# Altium project ArmBand-Control-Board.PrjPcb (part 3 of 3)

## Sheet Opamp-Sheet1.SchDoc
size A4; SheetNumber: 6; SheetTotal: 11
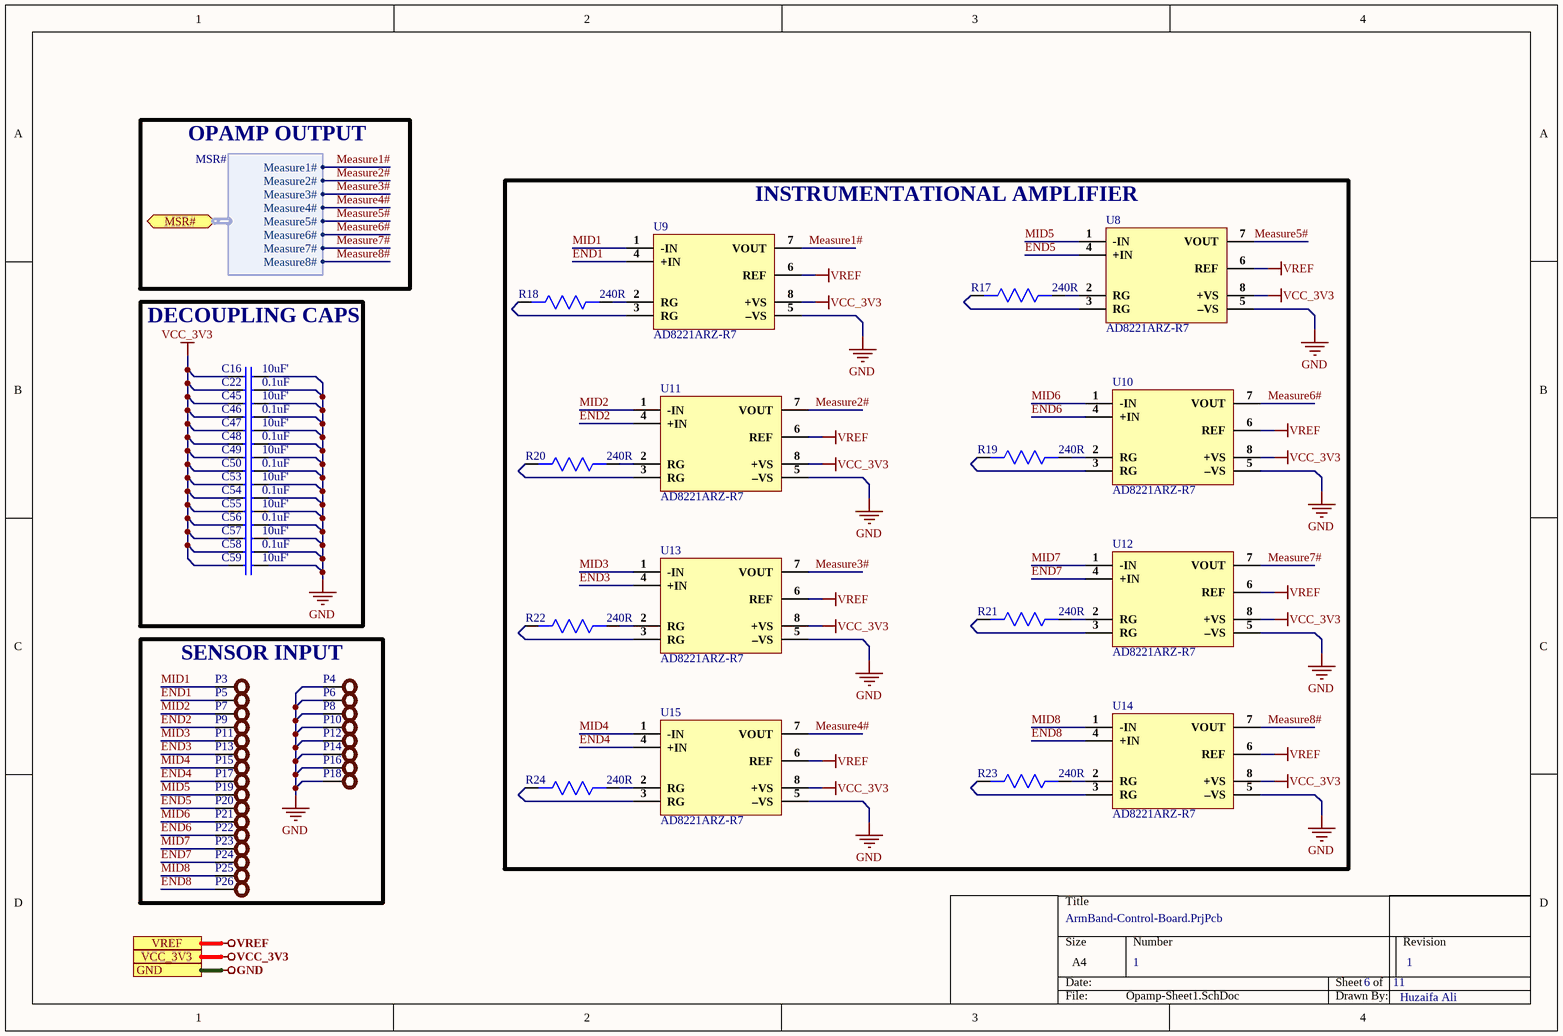
[diagram p9: Opamp-Sheet1.SchDoc]

### Parts
C16  10uF'  [Cap0603]
C22  0.1uF  [Cap 0402]
C45  10uF'  [Cap0603]
C46  0.1uF  [Cap 0402]
C47  10uF'  [Cap0603]
C48  0.1uF  [Cap 0402]
C49  10uF'  [Cap0603]
C50  0.1uF  [Cap 0402]
C53  10uF'  [Cap0603]
C54  0.1uF  [Cap 0402]
C55  10uF'  [Cap0603]
C56  0.1uF  [Cap 0402]
C57  10uF'  [Cap0603]
C58  0.1uF  [Cap 0402]
C59  10uF'  [Cap0603]
P3  Test Point  [TEST POINT]  (value not drawn)
P4  Test Point  [TEST POINT]  (value not drawn)
P5  Test Point  [TEST POINT]  (value not drawn)
P6  Test Point  [TEST POINT]  (value not drawn)
P7  Test Point  [TEST POINT]  (value not drawn)
P8  Test Point  [TEST POINT]  (value not drawn)
P9  Test Point  [TEST POINT]  (value not drawn)
P10  Test Point  [TEST POINT]  (value not drawn)
P11  Test Point  [TEST POINT]  (value not drawn)
P12  Test Point  [TEST POINT]  (value not drawn)
P13  Test Point  [TEST POINT]  (value not drawn)
P14  Test Point  [TEST POINT]  (value not drawn)
P15  Test Point  [TEST POINT]  (value not drawn)
P16  Test Point  [TEST POINT]  (value not drawn)
P17  Test Point  [TEST POINT]  (value not drawn)
P18  Test Point  [TEST POINT]  (value not drawn)
P19  Test Point  [TEST POINT]  (value not drawn)
P20  Test Point  [TEST POINT]  (value not drawn)
P21  Test Point  [TEST POINT]  (value not drawn)
P22  Test Point  [TEST POINT]  (value not drawn)
P23  Test Point  [TEST POINT]  (value not drawn)
P24  Test Point  [TEST POINT]  (value not drawn)
P25  Test Point  [TEST POINT]  (value not drawn)
P26  Test Point  [TEST POINT]  (value not drawn)
R17  240R  [Res0402]
R18  240R  [Res0402]
R19  240R  [Res0402]
R20  240R  [Res0402]
R21  240R  [Res0402]
R22  240R  [Res0402]
R23  240R  [Res0402]
R24  240R  [Res0402]
U8  AD8221ARZ-R7  [SOIC-8]
U9  AD8221ARZ-R7  [SOIC-8]
U10  AD8221ARZ-R7  [SOIC-8]
U11  AD8221ARZ-R7  [SOIC-8]
U12  AD8221ARZ-R7  [SOIC-8]
U13  AD8221ARZ-R7  [SOIC-8]
U14  AD8221ARZ-R7  [SOIC-8]
U15  AD8221ARZ-R7  [SOIC-8]

### Blocks framed on the sheet
INSTRUMENTATIONAL AMPLIFIER: R17-R24 U8-U15
DECOUPLING CAPS: C16 C22 C45-C50 C53-C59
SENSOR INPUT: P3-P26

### Ports
GND, MSR# (bidir, harness MSR#), VCC_3V3, VREF

### Harnesses
MSR#: Measure1#, Measure2#, Measure3#, Measure4#, Measure5#, Measure6#, Measure7#, Measure8#

### Nets
GND: C16.2 C22.2 C45.2 C46.2 C47.2 C48.2 C49.2 C50.2 C53.2 C54.2 C55.2 C56.2 C57.2 C58.2 C59.2 P4.1 P6.1 P8.1 P10.1 P12.1 P14.1 P16.1 P18.1 U8.5(–VS) U9.5(–VS) U10.5(–VS) U11.5(–VS) U12.5(–VS) U13.5(–VS) U14.5(–VS) U15.5(–VS) ; port GND
VCC_3V3: C16.1 C22.1 C45.1 C46.1 C47.1 C48.1 C49.1 C50.1 C53.1 C54.1 C55.1 C56.1 C57.1 C58.1 C59.1 U8.8(+VS) U9.8(+VS) U10.8(+VS) U11.8(+VS) U12.8(+VS) U13.8(+VS) U14.8(+VS) U15.8(+VS) ; port VCC_3V3
VREF: U8.6(REF) U9.6(REF) U10.6(REF) U11.6(REF) U12.6(REF) U13.6(REF) U14.6(REF) U15.6(REF) ; port VREF
END1: P5.1 U9.4(+IN)
END2: P9.1 U11.4(+IN)
END3: P13.1 U13.4(+IN)
END4: P17.1 U15.4(+IN)
END5: P20.1 U8.4(+IN)
END6: P22.1 U10.4(+IN)
END7: P24.1 U12.4(+IN)
END8: P26.1 U14.4(+IN)
Measure1#: U9.7(VOUT) ; port MSR#.Measure1#
Measure2#: U11.7(VOUT) ; port MSR#.Measure2#
Measure3#: U13.7(VOUT) ; port MSR#.Measure3#
Measure4#: U15.7(VOUT) ; port MSR#.Measure4#
Measure5#: U8.7(VOUT) ; port MSR#.Measure5#
Measure6#: U10.7(VOUT) ; port MSR#.Measure6#
Measure7#: U12.7(VOUT) ; port MSR#.Measure7#
Measure8#: U14.7(VOUT) ; port MSR#.Measure8#
MID1: P3.1 U9.1(-IN)
MID2: P7.1 U11.1(-IN)
MID3: P11.1 U13.1(-IN)
MID4: P15.1 U15.1(-IN)
MID5: P19.1 U8.1(-IN)
MID6: P21.1 U10.1(-IN)
MID7: P23.1 U12.1(-IN)
MID8: P25.1 U14.1(-IN)
NetR17_1: R17.1 U8.2(RG)
NetR17_2: R17.2 U8.3(RG)
NetR18_1: R18.1 U9.2(RG)
NetR18_2: R18.2 U9.3(RG)
NetR19_1: R19.1 U10.2(RG)
NetR19_2: R19.2 U10.3(RG)
NetR20_1: R20.1 U11.2(RG)
NetR20_2: R20.2 U11.3(RG)
NetR21_1: R21.1 U12.2(RG)
NetR21_2: R21.2 U12.3(RG)
NetR22_1: R22.1 U13.2(RG)
NetR22_2: R22.2 U13.3(RG)
NetR23_1: R23.1 U14.2(RG)
NetR23_2: R23.2 U14.3(RG)
NetR24_1: R24.1 U15.2(RG)
NetR24_2: R24.2 U15.3(RG)

### Notes on the sheet
- OPAMP OUTPUT
- 1
- Huzaifa Ali

### Library data of the parts
C16 C45 C47 C49 C53 C55 C57 C59 = CL10A106MA8NRNC: CAP CER 10UF 25V X5R 0603; Manufacturer: Samsung; Tolerance: 20%; Supplier 1: Avnet; Manufacturer Part Number: CL10A106MA8NRNC; RoHS: Yes; Category: Ceramic Capacitors; Pricing 1: 4000=0.03753, 8000=0.03700, 16000=0.03595, 24000=0.03515, 32000=0.03383, 40000=0.03304, 400000=0.03225 (USD); Mount: Surface Mount; Case/Package: 0603; Case Code (Metric): 1608; Case Code (Imperial): 0603; Contact Plating: Tin; Min Operating Temperature: -55°C; Max Operating Temperature: 85°C; Package Quantity: 1; Packaging: Tape and Reel; Capacitance: 10uF; Voltage Rating: 25V; Dielectric: X5R; Termination: Wraparound; Series: CL; Construction: Flat; Length: 0.063inch; Width: 0.031inch; Thickness: 0.035inch; Lead Free: Lead Free; RoHS Compliant: Yes; ComponentLink1URL: https://datasheet.ciiva.com/25766/cl10a106ma8nrnc-25766562.pdf?src-supplier=Digi-Key; ComponentLink1Description: https://datasheet.ciiva.com/25766/cl10a106ma8nrnc-25766562.pdf?src-supplier=Digi-Key; Supplier Part Number 1: CL10A106MA8NRNC
C22 C46 C48 C50 C54 C56 C58 = GRM155R71H104ME14D: CAP CER 0.1UF 50V X7R 0402; Manufacturer: Murata; Tolerance: 20%; Capacitance: 100nF; Supplier 1: Digi-Key; Manufacturer Part Number: GRM155R71H104ME14D; Stock 1: 439844; Pricing 1: 1=0.1, 10=0.038, 100=0.0168, 500=0.01198, 1000=0.00941, 2500=0.00855, 5000=0.00787 (USD); Mount: Surface Mount; Case/Package: 0402; Min Operating Temperature: -55°C; Max Operating Temperature: 125°C; Packaging: Cut Tape; Voltage Rating: 50V; Length: 0.039inch; Width: 0.02inch; Thickness: 0.022inch; ComponentLink1URL: http://search.murata.co.jp/Ceramy/image/img/A01X/G101/ENG/GRM155R71H104ME14-01.pdf?src-supplier=Digi-Key; ComponentLink1Description: http://search.murata.co.jp/Ceramy/image/img/A01X/G101/ENG/GRM155R71H104ME14-01.pdf?src-supplier=Digi-Key; ComponentLink2URL: http://psearch.en.murata.com/capacitor/product/GRM155R71H104ME14%23.pdf?src-supplier=Avnet; ComponentLink2Description: http://psearch.en.murata.com/capacitor/product/GRM155R71H104ME14%23.pdf?src-supplier=Avnet; ComponentLink3URL: http://components.arrow.com/part/dataview/0323_07177683?src-supplier=Arrow+Europe; ComponentLink3Description: http://components.arrow.com/part/dataview/0323_07177683?src-supplier=Arrow+Europe; ComponentLink4URL: http://www.mouser.com/ds/2/281/c02e-2905.pdf?src-supplier=Mouser; ComponentLink4Description: http://www.mouser.com/ds/2/281/c02e-2905.pdf?src-supplier=Mouser; Supplier Part Number 1: 490-10701-1-ND
P3-P26 = TEST POINT: Test Point ON
R17-R24 = RC0402FR-07240RL: RES SMD 0402 240 Ohm 1% 1/16W ±100ppm/°C Molded SMD Paper T/R; Manufacturer: Yageo; Power Rating: 63mW; Voltage Rating (DC): 50V; Supplier 1: Arrow Electronics; Manufacturer Part Number: RC0402FR-07240RL; RoHS: Yes; Category: Chip SMD Resistors; Stock 1: 3138480; Pricing 1: 10000=0.00190 (USD); Case/Package: 0402; Case Code (Metric): 1005; Case Code (Imperial): 0402; Size Code: 0402; Min Operating Temperature: -55°C; Max Operating Temperature: 155°C; Resistance: 240R; Tolerance: 1%; Packaging: Tape and Reel; Resistor Type: Thick Film; Temperature Coefficient: 100ppm/°C; Voltage Rating: 50V; Package Quantity: 1; Number of Terminations: 2; Termination: SMD/SMT; Max Power Dissipation: 63mW; Features: Moisture Resistant; Series: RC; Construction: Rectangular; Resistance Tolerance: 1%; Length: 1mm; Width: 0.02inch; Height: 0.016inch; Depth: 0.5mm; REACH SVHC: Unknown; Lead Free: Lead Free; RoHS Compliant: Yes; Military Standard: Not; ComponentLink1URL: https://datasheet.ciiva.com/7849/1018594-7849915.pdf?src-supplier=Element14; ComponentLink1Description: https://datasheet.ciiva.com/7849/1018594-7849915.pdf?src-supplier=Element14; ComponentLink2URL: https://datasheet.ciiva.com/7849/1018594-7849916.pdf?src-supplier=Element14; ComponentLink2Description: https://datasheet.ciiva.com/7849/1018594-7849916.pdf?src-supplier=Element14; ComponentLink3URL: https://datasheet.ciiva.com/2519/pyu-r-int-thick-7-2519157.pdf?src-supplier=Digi-Key; ComponentLink3Description: https://datasheet.ciiva.com/2519/pyu-r-int-thick-7-2519157.pdf?src-supplier=Digi-Key; ComponentLink4URL: https://datasheet.ciiva.com/2519/pyu-r-int-thick-7-2519158.pdf?src-supplier=Digi-Key; ComponentLink4Description: https://datasheet.ciiva.com/2519/pyu-r-int-thick-7-2519158.pdf?src-supplier=Digi-Key; ComponentLink5URL: https://datasheet.ciiva.com/2519/pyu-r-int-thick-7-2519156.pdf?src-supplier=Digi-Key; ComponentLink5Description: https://datasheet.ciiva.com/2519/pyu-r-int-thick-7-2519156.pdf?src-supplier=Digi-Key; ComponentLink6URL: https://datasheet.ciiva.com/12669/pyu-rc0402-51-rohs-l-6-r-12669689.pdf?src-supplier=Mouser; ComponentLink6Description: https://datasheet.ciiva.com/12669/pyu-rc0402-51-rohs-l-6-r-12669689.pdf?src-supplier=Mouser; ComponentLink7URL: https://datasheet.ciiva.com/17419/pyu-rc0402-51-rohs-l-6-r-17419482.pdf?src-supplier=Future+Electronics; ComponentLink7Description: https://datasheet.ciiva.com/17419/pyu-rc0402-51-rohs-l-6-r-17419482.pdf?src-supplier=Future+Electronics; Supplier Part Number 1: RC0402FR-07240RL
U8-U15 = AD8221ARZ-R7: IC OPAMP INSTR 825KHZ 8SOIC; Manufacturer: Analog Devices; Number of Channels: 1; Common Mode Rejection Ratio: 80dB; Min Dual Supply Voltage: 2.3V; Max Dual Supply Voltage: 18V; Slew Rate: 2.5V/µs; Nominal Supply Current: 1mA; Max Power Dissipation: 200mW; Bandwidth: 562kHz; Input Bias Current: 1.5nA; Input Offset Voltage (Vos): 60uV; Output Current per Channel: 18mA; Power Supply Rejection Ratio (PSRR): 130dB; Voltage Gain: 60dB; Input Resistance: 100GR; Quiescent Current: 900uA; Operating Supply Voltage: 36V; Supplier 1: Mouser; Manufacturer Part Number: AD8221ARZ-R7; RoHS: Yes; Category: Amplifiers - Op Amps, Buffer, Instrumentation; Pricing 1: 1=7.37000, 10=6.66000, 25=6.35000, 50=6.35000, 100=5.51000, 250=5.27000, 500=4.80000, 1000=4.37000, 10000=4.37000 (USD); Case/Package: SOIC; Number of Pins: 8; Contact Plating: Tin,Matte; Min Operating Temperature: -40°C; Max Operating Temperature: 85°C; -3db Bandwidth: 825kHz; Package Quantity: 1000; Packaging: Tape and Reel; Number of Circuits: 1; Operating Supply Current: 1mA; Number of Elements: 1; Power Dissipation: 200mW; Series: -; Supply Current: 1mA; Radiation Hardening: No; Lead Free: Contains Lead; RoHS Compliant: Yes; ComponentLink1URL: https://datasheet.ciiva.com/15128/getdatasheetpartid-313520-15128733.pdf?src-supplier=Verical; ComponentLink1Description: https://datasheet.ciiva.com/15128/getdatasheetpartid-313520-15128733.pdf?src-supplier=Verical; ComponentLink2URL: https://datasheet.ciiva.com/2975/ad8221-2975658.pdf?src-supplier=Avnet; ComponentLink2Description: https://datasheet.ciiva.com/2975/ad8221-2975658.pdf?src-supplier=Avnet; ComponentLink3URL: https://datasheet.ciiva.com/2975/ad8221-2975980.pdf?src-supplier=Avnet; ComponentLink3Description: https://datasheet.ciiva.com/2975/ad8221-2975980.pdf?src-supplier=Avnet; ComponentLink4URL: https://datasheet.ciiva.com/6628/ad8221-6628618.pdf?src-supplier=Digi-Key; ComponentLink4Description: https://datasheet.ciiva.com/6628/ad8221-6628618.pdf?src-supplier=Digi-Key; ComponentLink5URL: https://datasheet.ciiva.com/6628/ad8221-6628619.pdf?src-supplier=Digi-Key; ComponentLink5Description: https://datasheet.ciiva.com/6628/ad8221-6628619.pdf?src-supplier=Digi-Key; ComponentLink6URL: https://datasheet.ciiva.com/6628/ad8221-6628617.pdf?src-supplier=Digi-Key; ComponentLink6Description: https://datasheet.ciiva.com/6628/ad8221-6628617.pdf?src-supplier=Digi-Key; ComponentLink7URL: https://datasheet.ciiva.com/48709/001249009-da-01-en-ic-amp-inst-prec-ad8221arz-r7-soic-8-adi-48709526.pdf?src-supplier=Conrad; ComponentLink7Description: https://datasheet.ciiva.com/48709/001249009-da-01-en-ic-amp-inst-prec-ad8221arz-r7-soic-8-adi-48709526.pdf?src-supplier=Conrad; Supplier Part Number 1: 584-AD8221ARZ-R7

## Sheet Opamp-Sheet2.SchDoc
size A4; SheetNumber: 11; SheetTotal: 12
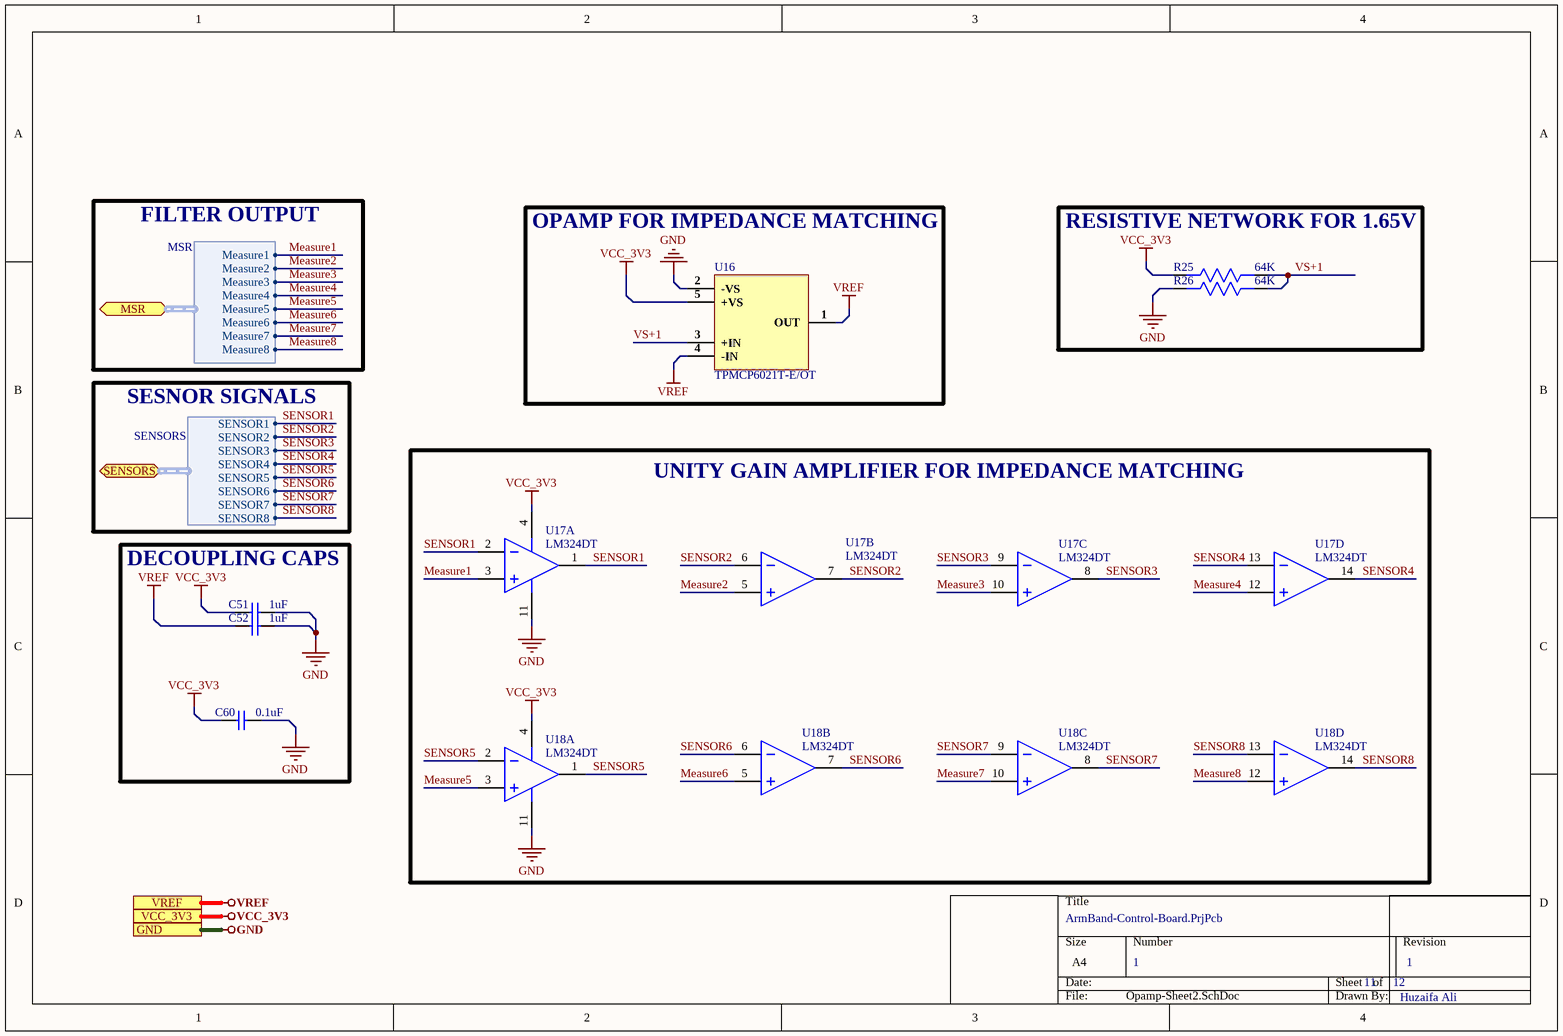
[diagram p10: Opamp-Sheet2.SchDoc]

### Parts
C51  1uF  [Cap 0402]
C52  1uF  [Cap 0402]
C60  0.1uF  [Cap 0402]
R25  64K  [Res0603]
R26  64K  [Res0603]
U16  TPMCP6021T-E/OT  [SOT-23-5]
U17  LM324DT  [SO-14]  (parts A,B,C,D of 4)
U18  LM324DT  [SO-14]  (parts A,B,C,D of 4)

### Blocks framed on the sheet
OPAMP FOR IMPEDANCE MATCHING: U16
RESISTIVE NETWORK FOR 1.65V: R25 R26
UNITY GAIN AMPLIFIER FOR IMPEDANCE MATCHING: U17 U18
DECOUPLING CAPS: C51 C52 C60

### Ports
GND, MSR (bidir, harness MSR), SENSORS (bidir, harness SENSORS), VCC_3V3, VREF

### Harnesses
SENSORS: SENSOR1, SENSOR2, SENSOR3, SENSOR4, SENSOR5, SENSOR6, SENSOR7, SENSOR8
MSR: Measure1, Measure2, Measure3, Measure4, Measure5, Measure6, Measure7, Measure8

### Nets
GND: C51.2 C52.2 C60.2 R26.2 U16.2(-VS) U17.11(VCC-) U18.11(VCC-) ; port GND
VCC_3V3: C51.1 C60.1 R25.2 U16.5(+VS) U17.4(VCC+) U18.4(VCC+) ; port VCC_3V3
VREF: C52.1 U16.1(OUT) U16.4(-IN) ; port VREF
Measure1: U17.3(IN+) ; port MSR.Measure1
Measure2: U17.5(2IN+) ; port MSR.Measure2
Measure3: U17.10(3IN+) ; port MSR.Measure3
Measure4: U17.12(4IN+) ; port MSR.Measure4
Measure5: U18.3(IN+) ; port MSR.Measure5
Measure6: U18.5(2IN+) ; port MSR.Measure6
Measure7: U18.10(3IN+) ; port MSR.Measure7
Measure8: U18.12(4IN+) ; port MSR.Measure8
SENSOR1: U17.1(1OUT) U17.2(IN-) ; port SENSORS.SENSOR1
SENSOR2: U17.6(2IN-) U17.7(2OUT) ; port SENSORS.SENSOR2
SENSOR3: U17.8(3OUT) U17.9(3IN-) ; port SENSORS.SENSOR3
SENSOR4: U17.13(4IN-) U17.14(4OUT) ; port SENSORS.SENSOR4
SENSOR5: U18.1(1OUT) U18.2(IN-) ; port SENSORS.SENSOR5
SENSOR6: U18.6(2IN-) U18.7(2OUT) ; port SENSORS.SENSOR6
SENSOR7: U18.8(3OUT) U18.9(3IN-) ; port SENSORS.SENSOR7
SENSOR8: U18.13(4IN-) U18.14(4OUT) ; port SENSORS.SENSOR8
VS+1: R25.1 R26.1 U16.3(+IN)

### Notes on the sheet
- FILTER OUTPUT
- SESNOR SIGNALS
- 1
- Huzaifa Ali

### Library data of the parts
C51 C52 = CC0402KRX5R7BB105: CAP CER 1UF 16V X5R 0402; Manufacturer: Yageo; Tolerance: 10%; Supplier 1: Digi-Key; Manufacturer Part Number: CC0402KRX5R7BB105; Stock 1: 1405667; Pricing 1: 1=0.36, 10=0.252, 100=0.1512, 500=0.1134, 1000=0.09576, 2500=0.09072, 5000=0.08568 (USD); Mount: Surface Mount; Case/Package: 0402; Weight: 2.3E-05oz; Case Code (Imperial): 0402; Case Code (Metric): 1005; Min Operating Temperature: -55°C; Max Operating Temperature: 85°C; Capacitance: 1uF; Dielectric: X5R; Packaging: Tape and Reel; Voltage Rating (DC): 16V; Voltage Rating: 16V; Termination: SMD/SMT; Composition: Ceramic; Length: 1mm; Height: 0.5mm; Width: 0.02inch; Thickness: 0.022inch; Depth: 0.5mm; Radiation Hardening: No; Lead Free: Lead Free; Halogen Free: Halogen Free; ComponentLink1URL: http://www.yageo.com/documents/recent/UPY-GPHC_X5R_4V-to-50V_12.pdf?src-supplier=Avnet+Europe; ComponentLink1Description: http://www.yageo.com/documents/recent/UPY-GPHC_X5R_4V-to-50V_12.pdf?src-supplier=Avnet+Europe; Supplier Part Number 1: 311-1691-6-ND
C60 = GRM155R71H104ME14D: as C22 on sheet Opamp-Sheet1; Supplier 1: Digi-Key; Manufacturer Part Number: GRM155R71H104ME14D; Stock 1: 439844; Pricing 1: 1=0.1, 10=0.038, 100=0.0168, 500=0.01198, 1000=0.00941, 2500=0.00855, 5000=0.00787 (USD); Mount: Surface Mount; Case/Package: 0402; Min Operating Temperature: -55°C; Max Operating Temperature: 125°C; Packaging: Cut Tape; Voltage Rating: 50V; Length: 0.039inch; Width: 0.02inch; Thickness: 0.022inch; ComponentLink1URL: http://search.murata.co.jp/Ceramy/image/img/A01X/G101/ENG/GRM155R71H104ME14-01.pdf?src-supplier=Digi-Key; ComponentLink1Description: http://search.murata.co.jp/Ceramy/image/img/A01X/G101/ENG/GRM155R71H104ME14-01.pdf?src-supplier=Digi-Key; ComponentLink2URL: http://psearch.en.murata.com/capacitor/product/GRM155R71H104ME14%23.pdf?src-supplier=Avnet; ComponentLink2Description: http://psearch.en.murata.com/capacitor/product/GRM155R71H104ME14%23.pdf?src-supplier=Avnet; ComponentLink3URL: http://components.arrow.com/part/dataview/0323_07177683?src-supplier=Arrow+Europe; ComponentLink3Description: http://components.arrow.com/part/dataview/0323_07177683?src-supplier=Arrow+Europe; ComponentLink4URL: http://www.mouser.com/ds/2/281/c02e-2905.pdf?src-supplier=Mouser; ComponentLink4Description: http://www.mouser.com/ds/2/281/c02e-2905.pdf?src-supplier=Mouser; Supplier Part Number 1: 490-10701-1-ND
R25 R26 = ARG03DTC6402N: 1/10W Thin Film Resistor 75V ±0.5% ±25ppm/℃ -55℃~+155℃ 64kΩ 0603 Chip Resistor - Surface Mount ROHS; Manufacturer: iking Tech; Manufacture Part num:: ARG03DTC6402N; Package: 0603; VAlue: 64K
U16 = TPMCP6021T-E/OT: SOT-23-5 Operational Amplifier ROHS; Manufaturere: TECH PUBLIC; Manufacture Part num:: TPMCP6021T-E/OT; Package: SOT-23-5
U17 U18 = LM324DT: IC OPAMP GP 1.3MHZ 14SO; Manufacturer: STMicroelectronics; Max Supply Voltage: 30V; Min Supply Voltage: 3V; Min Dual Supply Voltage: 1.5V; Max Dual Supply Voltage: 15V; Voltage Gain: 100dB; Slew Rate: 0.4V/µs; Common Mode Rejection Ratio: 70dB; Nominal Supply Current: 1.2mA; Input Offset Voltage (Vos): 7mV; Input Bias Current: 150nA; Number of Circuits: 4; Output Current per Channel: 40mA; Dual Supply Voltage: 12V; Supply Type: Single,Dual; Input Voltage Noise Density: 40nV/sqrt Hz; Max Power Dissipation: 400mW; Supplier 1: Arrow Electronics; Manufacturer Part Number: LM324DT; RoHS: Yes; Category: Amplifiers - Op Amps, Buffer, Instrumentation; Stock 1: 287500; Pricing 1: 2500=0.18900 (USD); Mount: Surface Mount; Case/Package: SO; Number of Pins: 14; Contact Plating: Tin,Matte; Weight: 0.009143oz; Min Operating Temperature: 0°C; Max Operating Temperature: 70°C; Gain Bandwidth Product: 1.3MHz; Packaging: Cut Tape; Package Quantity: 2500; Operating Supply Current: 1.2mA; Operating Supply Voltage: 15V; Number of Channels: 4; Output Current: 40mA; Number of Elements: 4; Series: LM324; Technology: BIPOLAR; Bandwidth: 1.3MHz; Number of Amplifiers: 4; Unity Gain Bandwidth Product: 1.3MHz; Length: 8.75mm; Width: 4mm; Height: 1.65mm; Radiation Hardening: No; RoHS Compliant: Yes; Lead Free: Lead Free; REACH SVHC: No SVHC; ComponentLink1URL: https://datasheet.ciiva.com/4758/cd00000457-103203-4758032.pdf?src-supplier=Mouser; ComponentLink1Description: https://datasheet.ciiva.com/4758/cd00000457-103203-4758032.pdf?src-supplier=Mouser; ComponentLink2URL: https://datasheet.ciiva.com/8008/1834360-8008827.pdf?src-supplier=Element14; ComponentLink2Description: https://datasheet.ciiva.com/8008/1834360-8008827.pdf?src-supplier=Element14; ComponentLink3URL: https://datasheet.ciiva.com/8008/1834360-8008490.pdf?src-supplier=Element14; ComponentLink3Description: https://datasheet.ciiva.com/8008/1834360-8008490.pdf?src-supplier=Element14; ComponentLink4URL: https://datasheet.ciiva.com/28630/1834360-28630538.pdf?src-supplier=Element14; ComponentLink4Description: https://datasheet.ciiva.com/28630/1834360-28630538.pdf?src-supplier=Element14; ComponentLink5URL: https://datasheet.ciiva.com/1795/cd00000457-1795560.pdf?src-supplier=Digi-Key; ComponentLink5Description: https://datasheet.ciiva.com/1795/cd00000457-1795560.pdf?src-supplier=Digi-Key; ComponentLink6URL: https://datasheet.ciiva.com/1795/cd00000457-1795559.pdf?src-supplier=Digi-Key; ComponentLink6Description: https://datasheet.ciiva.com/1795/cd00000457-1795559.pdf?src-supplier=Digi-Key; ComponentLink7URL: https://datasheet.ciiva.com/1795/cd00000457-1795561.pdf?src-supplier=Digi-Key; ComponentLink7Description: https://datasheet.ciiva.com/1795/cd00000457-1795561.pdf?src-supplier=Digi-Key; ComponentLink8URL: https://datasheet.ciiva.com/16375/cd00000457-16375528.pdf?src-supplier=Future+Electronics; ComponentLink8Description: https://datasheet.ciiva.com/16375/cd00000457-16375528.pdf?src-supplier=Future+Electronics; Supplier Part Number 1: LM324DT

## Sheet Filter-Section.SchDoc
size A4; SheetNumber: 8; SheetTotal: 11
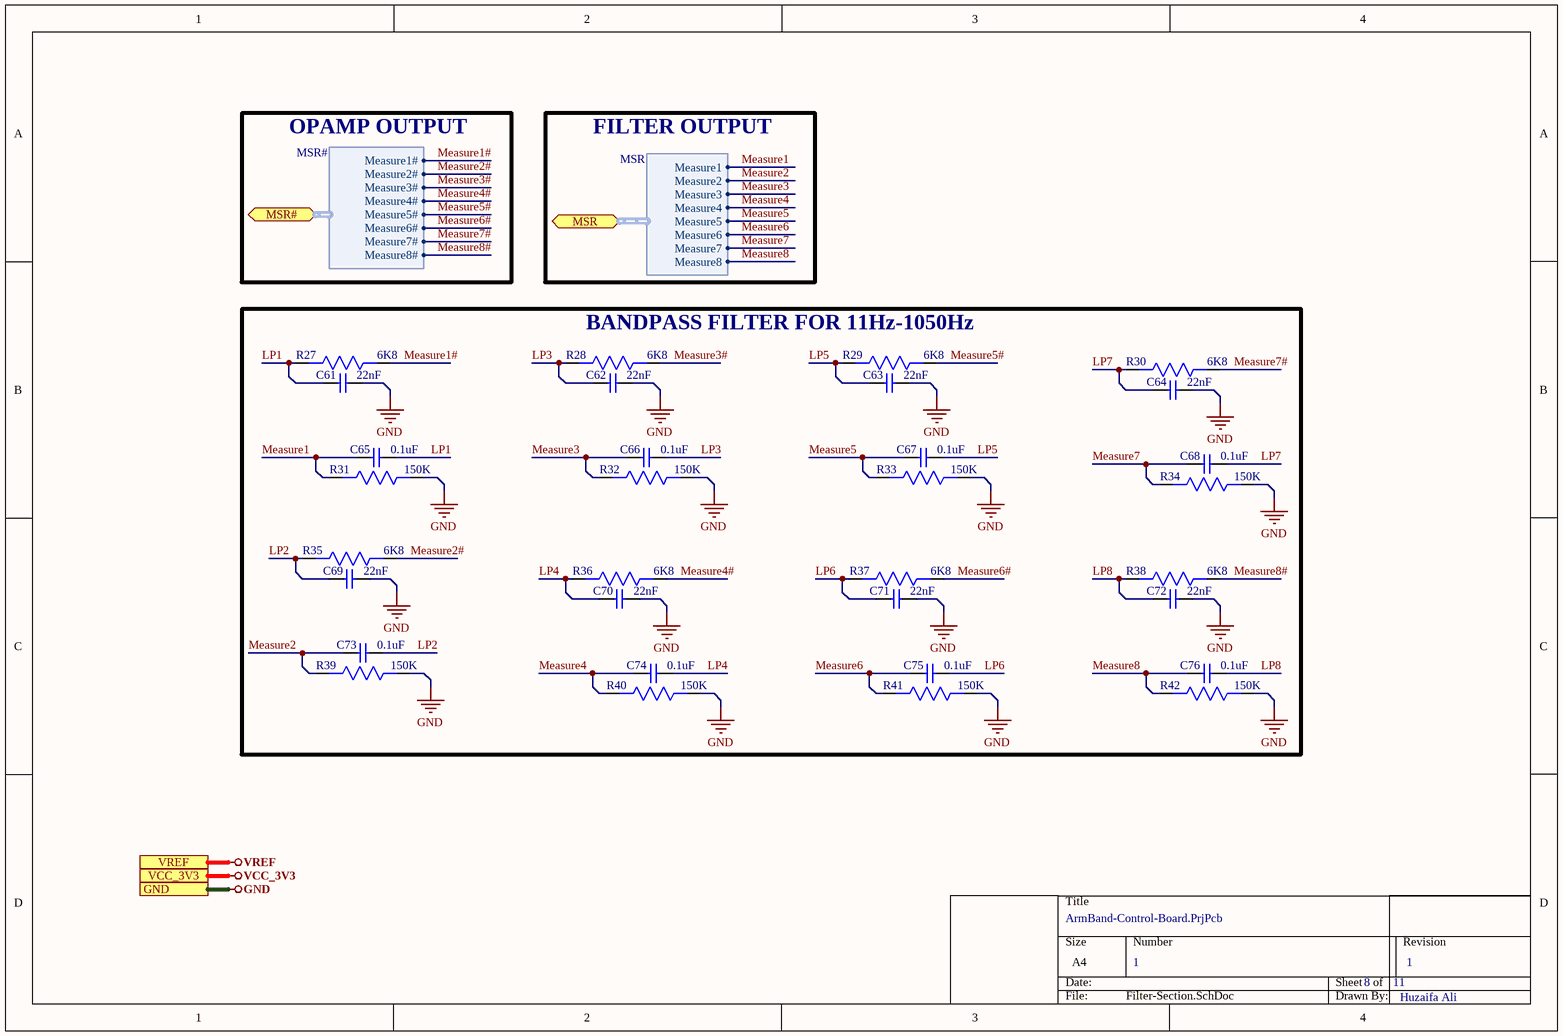
[diagram p11: Filter-Section.SchDoc]

### Parts
C61  22nF  [Cap 0402]
C62  22nF  [Cap 0402]
C63  22nF  [Cap 0402]
C64  22nF  [Cap 0402]
C65  0.1uF  [Cap 0402]
C66  0.1uF  [Cap 0402]
C67  0.1uF  [Cap 0402]
C68  0.1uF  [Cap 0402]
C69  22nF  [Cap 0402]
C70  22nF  [Cap 0402]
C71  22nF  [Cap 0402]
C72  22nF  [Cap 0402]
C73  0.1uF  [Cap 0402]
C74  0.1uF  [Cap 0402]
C75  0.1uF  [Cap 0402]
C76  0.1uF  [Cap 0402]
R27  6K8  [Res0402]
R28  6K8  [Res0402]
R29  6K8  [Res0402]
R30  6K8  [Res0402]
R31  150K  [Res0402]
R32  150K  [Res0402]
R33  150K  [Res0402]
R34  150K  [Res0402]
R35  6K8  [Res0402]
R36  6K8  [Res0402]
R37  6K8  [Res0402]
R38  6K8  [Res0402]
R39  150K  [Res0402]
R40  150K  [Res0402]
R41  150K  [Res0402]
R42  150K  [Res0402]

### Blocks framed on the sheet
BANDPASS FILTER FOR 11Hz-1050Hz: C61-C76 R27-R42

### Ports
GND, MSR (bidir, harness MSR), MSR# (bidir, harness MSR#), VCC_3V3, VREF

### Harnesses
MSR: Measure1, Measure2, Measure3, Measure4, Measure5, Measure6, Measure7, Measure8
MSR#: Measure1#, Measure2#, Measure3#, Measure4#, Measure5#, Measure6#, Measure7#, Measure8#

### Nets
GND: C61.2 C62.2 C63.2 C64.2 C69.2 C70.2 C71.2 C72.2 R31.1 R32.1 R33.1 R34.1 R39.1 R40.1 R41.1 R42.1 ; port GND
LP1: C61.1 C65.2 R27.2
LP2: C69.1 C73.2 R35.2
LP3: C62.1 C66.2 R28.2
LP4: C70.1 C74.2 R36.2
LP5: C63.1 C67.2 R29.2
LP6: C71.1 C75.2 R37.2
LP7: C64.1 C68.2 R30.2
LP8: C72.1 C76.2 R38.2
Measure1: C65.1 R31.2 ; port MSR.Measure1
Measure1#: R27.1 ; port MSR#.Measure1#
Measure2: C73.1 R39.2 ; port MSR.Measure2
Measure2#: R35.1 ; port MSR#.Measure2#
Measure3: C66.1 R32.2 ; port MSR.Measure3
Measure3#: R28.1 ; port MSR#.Measure3#
Measure4: C74.1 R40.2 ; port MSR.Measure4
Measure4#: R36.1 ; port MSR#.Measure4#
Measure5: C67.1 R33.2 ; port MSR.Measure5
Measure5#: R29.1 ; port MSR#.Measure5#
Measure6: C75.1 R41.2 ; port MSR.Measure6
Measure6#: R37.1 ; port MSR#.Measure6#
Measure7: C68.1 R34.2 ; port MSR.Measure7
Measure7#: R30.1 ; port MSR#.Measure7#
Measure8: C76.1 R42.2 ; port MSR.Measure8
Measure8#: R38.1 ; port MSR#.Measure8#

### Notes on the sheet
- OPAMP OUTPUT
- FILTER OUTPUT
- 1
- Huzaifa Ali

### Library data of the parts
C61-C64 C69-C72 = CGA2B2X7R1E223KT0Y0F: Cap Ceramic 0.022uF 25V X7R 10% Pad SMD 0402; Manufacturer: TDK; Manufacturer Part Number: CGA2B2X7R1E223K050BA; Supplier 1: RSComponents; RoHS: Yes; Category: Ceramic Capacitors; Stock 1: 15000; Pricing 1: 500=0.01900, 5000=0.01200 (USD); Mount: Surface Mount; Case/Package: 0402; Case Code (Imperial): 0402; Case Code (Metric): 1005; Weight: 2.3E-05oz; Min Operating Temperature: -55°C; Max Operating Temperature: 125°C; Capacitance: 22nF; Voltage Rating (DC): 25V; Tolerance: 10%; Packaging: Tape and Reel; Package Quantity: 1; Voltage Rating: 25V; Dielectric: X7R; Termination: SMD/SMT; Resistor Type: Ceramic; Series: CGA; Length: 1mm; Width: 0.5mm; Height: 0.5mm; Thickness: 0.022inch; Depth: 0.5mm; Ratings: AEC-Q200; REACH SVHC: No SVHC; RoHS Compliant: Yes; ComponentLink1URL: https://datasheet.ciiva.com/24220/cga2b2x7r1e223k050ba-265693-24220032.pdf?src-supplier=Mouser; ComponentLink1Description: https://datasheet.ciiva.com/24220/cga2b2x7r1e223k050ba-265693-24220032.pdf?src-supplier=Mouser; Supplier Part Number 1: 9155588
C65-C68 C73-C76 = GRM155R71H104ME14D: as C22 on sheet Opamp-Sheet1; Supplier 1: Digi-Key; Manufacturer Part Number: GRM155R71H104ME14D; Stock 1: 439844; Pricing 1: 1=0.1, 10=0.038, 100=0.0168, 500=0.01198, 1000=0.00941, 2500=0.00855, 5000=0.00787 (USD); Mount: Surface Mount; Case/Package: 0402; Min Operating Temperature: -55°C; Max Operating Temperature: 125°C; Packaging: Cut Tape; Voltage Rating: 50V; Length: 0.039inch; Width: 0.02inch; Thickness: 0.022inch; ComponentLink1URL: http://search.murata.co.jp/Ceramy/image/img/A01X/G101/ENG/GRM155R71H104ME14-01.pdf?src-supplier=Digi-Key; ComponentLink1Description: http://search.murata.co.jp/Ceramy/image/img/A01X/G101/ENG/GRM155R71H104ME14-01.pdf?src-supplier=Digi-Key; ComponentLink2URL: http://psearch.en.murata.com/capacitor/product/GRM155R71H104ME14%23.pdf?src-supplier=Avnet; ComponentLink2Description: http://psearch.en.murata.com/capacitor/product/GRM155R71H104ME14%23.pdf?src-supplier=Avnet; ComponentLink3URL: http://components.arrow.com/part/dataview/0323_07177683?src-supplier=Arrow+Europe; ComponentLink3Description: http://components.arrow.com/part/dataview/0323_07177683?src-supplier=Arrow+Europe; ComponentLink4URL: http://www.mouser.com/ds/2/281/c02e-2905.pdf?src-supplier=Mouser; ComponentLink4Description: http://www.mouser.com/ds/2/281/c02e-2905.pdf?src-supplier=Mouser; Supplier Part Number 1: 490-10701-1-ND
R27-R30 R35-R38 = RC0402JR-076K8L: Res Thick Film 0402 6.8K Ohm 5% 0.063W(1/16W) ±100ppm/C Pad SMD T/R; Manufacturer: Yageo; Resistance: 6.8kR; Power Rating: 63mW; Voltage Rating: 50V; Temperature Coefficient: 100ppm/°C; Supplier 1: Arrow Electronics; Manufacturer Part Number: RC0402JR-076K8L; RoHS: Yes; Category: Chip SMD Resistors; Stock 1: 10110; Pricing 1: 1=0.08660, 10=0.01760, 25=0.01340, 100=0.00570, 500=0.00400, 1000=0.00230, 3000=0.00200, 6000=0.00170 (USD); Case/Package: 0402; Number of Pins: 2; Case Code (Metric): 1005; Case Code (Imperial): 0402; Weight: 2.3E-05oz; Min Operating Temperature: -55°C; Max Operating Temperature: 155°C; Package Quantity: 1; Tolerance: 5%; Packaging: Tape and Reel; Voltage Rating (DC): 50V; Resistor Type: Thick Film; Number of Terminations: 2; Termination: SMD/SMT; Max Power Dissipation: 63mW; Working Voltage: 50V; Features: Moisture Resistant; Series: RC; Technology: THICK FILM; Resistance Tolerance: 5%; Construction: Rectangular; Length: 1mm; Width: 0.5mm; Height: 0.016inch; Depth: 0.5mm; REACH SVHC: No SVHC; Military Standard: Not; Lead Free: Lead Free; RoHS Compliant: Yes; ComponentLink1URL: https://datasheet.ciiva.com/22643/1018594-22643413.pdf?src-supplier=Element14; ComponentLink1Description: https://datasheet.ciiva.com/22643/1018594-22643413.pdf?src-supplier=Element14; ComponentLink2URL: https://datasheet.ciiva.com/2452/pyu-r-int-thick-7-2452783.pdf?src-supplier=Digi-Key; ComponentLink2Description: https://datasheet.ciiva.com/2452/pyu-r-int-thick-7-2452783.pdf?src-supplier=Digi-Key; ComponentLink3URL: https://datasheet.ciiva.com/2452/pyu-r-int-thick-7-2452784.pdf?src-supplier=Digi-Key; ComponentLink3Description: https://datasheet.ciiva.com/2452/pyu-r-int-thick-7-2452784.pdf?src-supplier=Digi-Key; ComponentLink4URL: https://datasheet.ciiva.com/2452/pyu-r-int-thick-7-2452782.pdf?src-supplier=Digi-Key; ComponentLink4Description: https://datasheet.ciiva.com/2452/pyu-r-int-thick-7-2452782.pdf?src-supplier=Digi-Key; ComponentLink5URL: https://datasheet.ciiva.com/6067/1018594-6067880.pdf?src-supplier=Farnell; ComponentLink5Description: https://datasheet.ciiva.com/6067/1018594-6067880.pdf?src-supplier=Farnell; ComponentLink6URL: https://datasheet.ciiva.com/15189/getdatasheetpartid-326392-15189579.pdf?src-supplier=Verical; ComponentLink6Description: https://datasheet.ciiva.com/15189/getdatasheetpartid-326392-15189579.pdf?src-supplier=Verical; Supplier Part Number 1: RC0402JR-076K8L
R31-R34 R39-R42 = RC0402JR-07150KL: RES SMD 0402 150kOhm 5% Paper T/R; Manufacturer: Yageo; Resistance: 150kR; Power Rating: 63mW; Voltage Rating: 50V; Temperature Coefficient: 100ppm/°C; Supplier 1: Arrow Electronics; Manufacturer Part Number: RC0402JR-07150KL; RoHS: Yes; Category: Chip SMD Resistors; Stock 1: 170000; Pricing 1: 10000=0.00100 (USD); Case/Package: 0402; Case Code (Metric): 1005; Case Code (Imperial): 0402; Weight: 2.3E-05oz; Size Code: 0402; Min Operating Temperature: -55°C; Max Operating Temperature: 155°C; Package Quantity: 1; Tolerance: 5%; Packaging: Tape and Reel; Resistor Type: Thick Film; Number of Terminations: 2; Termination: SMD/SMT; Max Power Dissipation: 63mW; Features: Moisture Resistant; Series: RC; Construction: Rectangular; Resistance Tolerance: 5%; Length: 1mm; Width: 0.02inch; Height: 0.016inch; Depth: 0.5mm; REACH SVHC: No SVHC; Military Standard: Not; Lead Free: Lead Free; RoHS Compliant: Yes; ComponentLink1URL: https://datasheet.ciiva.com/7983/1018594-7983551.pdf?src-supplier=Element14; ComponentLink1Description: https://datasheet.ciiva.com/7983/1018594-7983551.pdf?src-supplier=Element14; ComponentLink2URL: https://datasheet.ciiva.com/2518/pyu-r-int-thick-7-2518929.pdf?src-supplier=Digi-Key; ComponentLink2Description: https://datasheet.ciiva.com/2518/pyu-r-int-thick-7-2518929.pdf?src-supplier=Digi-Key; ComponentLink3URL: https://datasheet.ciiva.com/2518/pyu-r-int-thick-7-2518930.pdf?src-supplier=Digi-Key; ComponentLink3Description: https://datasheet.ciiva.com/2518/pyu-r-int-thick-7-2518930.pdf?src-supplier=Digi-Key; ComponentLink4URL: https://datasheet.ciiva.com/2518/pyu-r-int-thick-7-2518928.pdf?src-supplier=Digi-Key; ComponentLink4Description: https://datasheet.ciiva.com/2518/pyu-r-int-thick-7-2518928.pdf?src-supplier=Digi-Key; ComponentLink5URL: https://datasheet.ciiva.com/7850/1018594-7850149.pdf?src-supplier=Element14; ComponentLink5Description: https://datasheet.ciiva.com/7850/1018594-7850149.pdf?src-supplier=Element14; ComponentLink6URL: https://datasheet.ciiva.com/17072/pyu-rc0402-51-rohs-l-6-r-17072379.pdf?src-supplier=Future+Electronics; ComponentLink6Description: https://datasheet.ciiva.com/17072/pyu-rc0402-51-rohs-l-6-r-17072379.pdf?src-supplier=Future+Electronics; ComponentLink7URL: https://datasheet.ciiva.com/15189/getdatasheetpartid-251830-15189543.pdf?src-supplier=Verical; ComponentLink7Description: https://datasheet.ciiva.com/15189/getdatasheetpartid-251830-15189543.pdf?src-supplier=Verical; Supplier Part Number 1: RC0402JR-07150KL

## Nets that join several sheets
GND: Switching-Regulators (15 pins), Battery-Charging-Section (9 pins), Controller-Section (26 pins), IMU-Section (6 pins), BLE-Section (19 pins), Connector-Section (17 pins), Opamp-Sheet1 (31 pins), Opamp-Sheet2 (7 pins), Filter-Section (16 pins)
VBAT: Switching-Regulators (5 pins), Battery-Charging-Section (C2.1 U1.10), Connector-Section (J3.1)
VCC_3V3: Switching-Regulators (C7.1 C8.1 U4.1 U4.10), Controller-Section (15 pins), IMU-Section (7 pins), BLE-Section (5 pins), Connector-Section (13 pins), Opamp-Sheet1 (23 pins), Opamp-Sheet2 (6 pins)
VREF: Opamp-Sheet1 (8 pins), Opamp-Sheet2 (C52.1 U16.1 U16.4)
VUSB: Battery-Charging-Section (C1.1 U1.1), Connector-Section (J2.1)
BATT_STAT.STAT1: Battery-Charging-Section (U1.3), Controller-Section (U5.48)
BATT_STAT.STAT2: Battery-Charging-Section (U1.4), Controller-Section (U5.47)
CTP_INT: Controller-Section (U5.37), Connector-Section (J5.5)
CTP_RST: Controller-Section (U5.26), Connector-Section (J5.4)
CTP_SCL: Controller-Section (SB5.1), Connector-Section (J5.2)
CTP_SDA: Controller-Section (SB4.1), Connector-Section (J5.3)
DDM: Controller-Section (U5.56), Connector-Section (J2.2)
DDP: Controller-Section (U5.57), Connector-Section (J2.3)
INT1: Controller-Section (U5.35), IMU-Section (U7.4)
INT2: Controller-Section (U5.34), IMU-Section (U7.9)
LCD_CS: Controller-Section (U5.28), Connector-Section (J4.9)
LCD_IO: Controller-Section (U5.20), Connector-Section (J4.5)
LCD_MISO: Controller-Section (U5.27), Connector-Section (J4.8)
LCD_MOSI: Controller-Section (U5.22), Connector-Section (J4.6)
LCD_RST: Controller-Section (U5.19), Connector-Section (J4.10)
LCD_SCLK: Controller-Section (U5.21), Connector-Section (J4.7)
Measure1: Opamp-Sheet2 (U17.3), Filter-Section (C65.1 R31.2)
Measure1#: Opamp-Sheet1 (U9.7), Filter-Section (R27.1)
Measure2: Opamp-Sheet2 (U17.5), Filter-Section (C73.1 R39.2)
Measure2#: Opamp-Sheet1 (U11.7), Filter-Section (R35.1)
Measure3: Opamp-Sheet2 (U17.10), Filter-Section (C66.1 R32.2)
Measure3#: Opamp-Sheet1 (U13.7), Filter-Section (R28.1)
Measure4: Opamp-Sheet2 (U17.12), Filter-Section (C74.1 R40.2)
Measure4#: Opamp-Sheet1 (U15.7), Filter-Section (R36.1)
Measure5: Opamp-Sheet2 (U18.3), Filter-Section (C67.1 R33.2)
Measure5#: Opamp-Sheet1 (U8.7), Filter-Section (R29.1)
Measure6: Opamp-Sheet2 (U18.5), Filter-Section (C75.1 R41.2)
Measure6#: Opamp-Sheet1 (U10.7), Filter-Section (R37.1)
Measure7: Opamp-Sheet2 (U18.10), Filter-Section (C68.1 R34.2)
Measure7#: Opamp-Sheet1 (U12.7), Filter-Section (R30.1)
Measure8: Opamp-Sheet2 (U18.12), Filter-Section (C76.1 R42.2)
Measure8#: Opamp-Sheet1 (U14.7), Filter-Section (R38.1)
SCL: Controller-Section (U5.36), IMU-Section (R10.1 U7.13)
SDA: Controller-Section (U5.43), IMU-Section (R11.1 U7.14)
SENSOR1: Controller-Section (U5.9), Opamp-Sheet2 (U17.1 U17.2)
SENSOR2: Controller-Section (U5.10), Opamp-Sheet2 (U17.6 U17.7)
SENSOR3: Controller-Section (U5.13), Opamp-Sheet2 (U17.8 U17.9)
SENSOR4: Controller-Section (U5.16), Opamp-Sheet2 (U17.13 U17.14)
SENSOR5: Controller-Section (U5.3), Opamp-Sheet2 (U18.1 U18.2)
SENSOR6: Controller-Section (U5.4), Opamp-Sheet2 (U18.6 U18.7)
SENSOR7: Controller-Section (U5.5), Opamp-Sheet2 (U18.8 U18.9)
SENSOR8: Controller-Section (U5.6), Opamp-Sheet2 (U18.13 U18.14)
SWDCLK: BLE-Section (U6.24), Connector-Section (P2.3)
SWDIO: BLE-Section (U6.23), Connector-Section (P2.2)
TCK: Controller-Section (U5.53), Connector-Section (P1.5 R16.1)
TDI: Controller-Section (U5.33), Connector-Section (P1.2 R13.1)
TDO: Controller-Section (SB4.2 U5.49), Connector-Section (P1.3 R14.1)
TMS: Controller-Section (SB5.2 U5.51), Connector-Section (P1.4 R15.1)
UART_CTS: Controller-Section (U5.25), BLE-Section (U6.16)
UART_RTS: Controller-Section (U5.23), BLE-Section (U6.14)
UART_RXD: Controller-Section (U5.11), BLE-Section (U6.17)
UART_TXD: Controller-Section (U5.14), BLE-Section (U6.15)